# Altium schematic sheet a0206-2006.8.SchDoc
size 558 x 431 mm
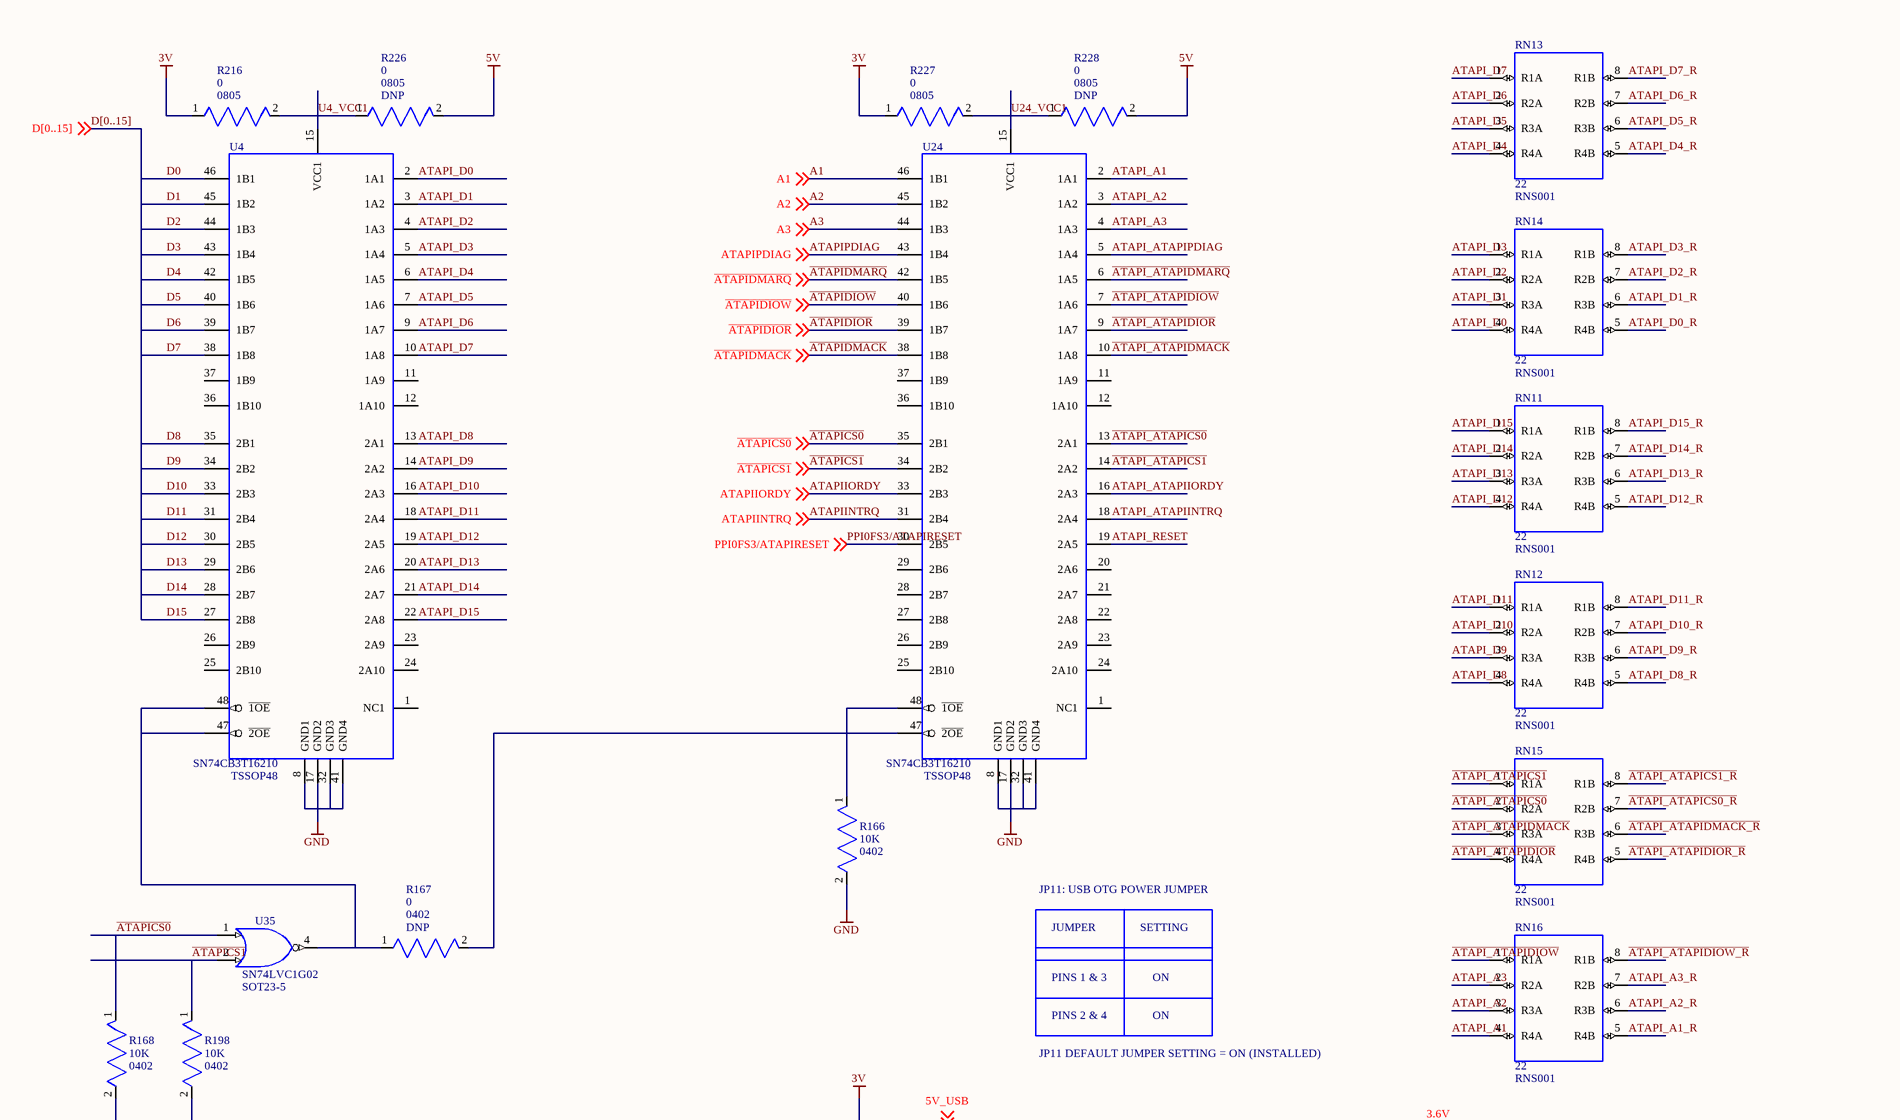
[diagram p0: a0206-2006.8.SchDoc, top left]
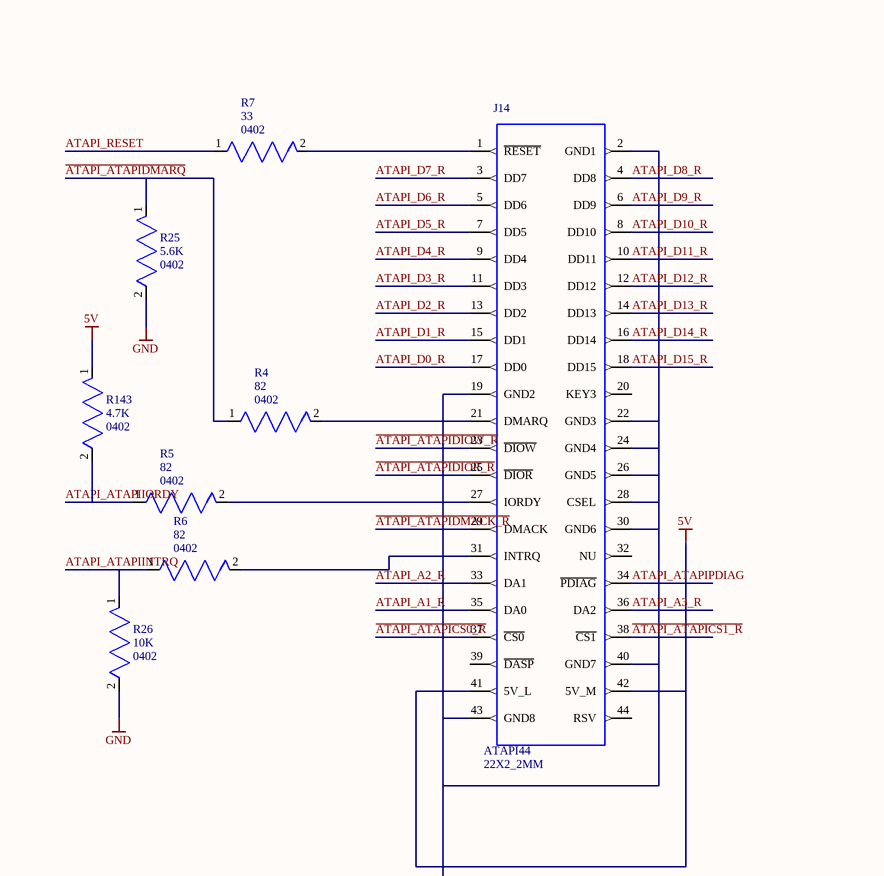
[diagram p1: a0206-2006.8.SchDoc, top right]
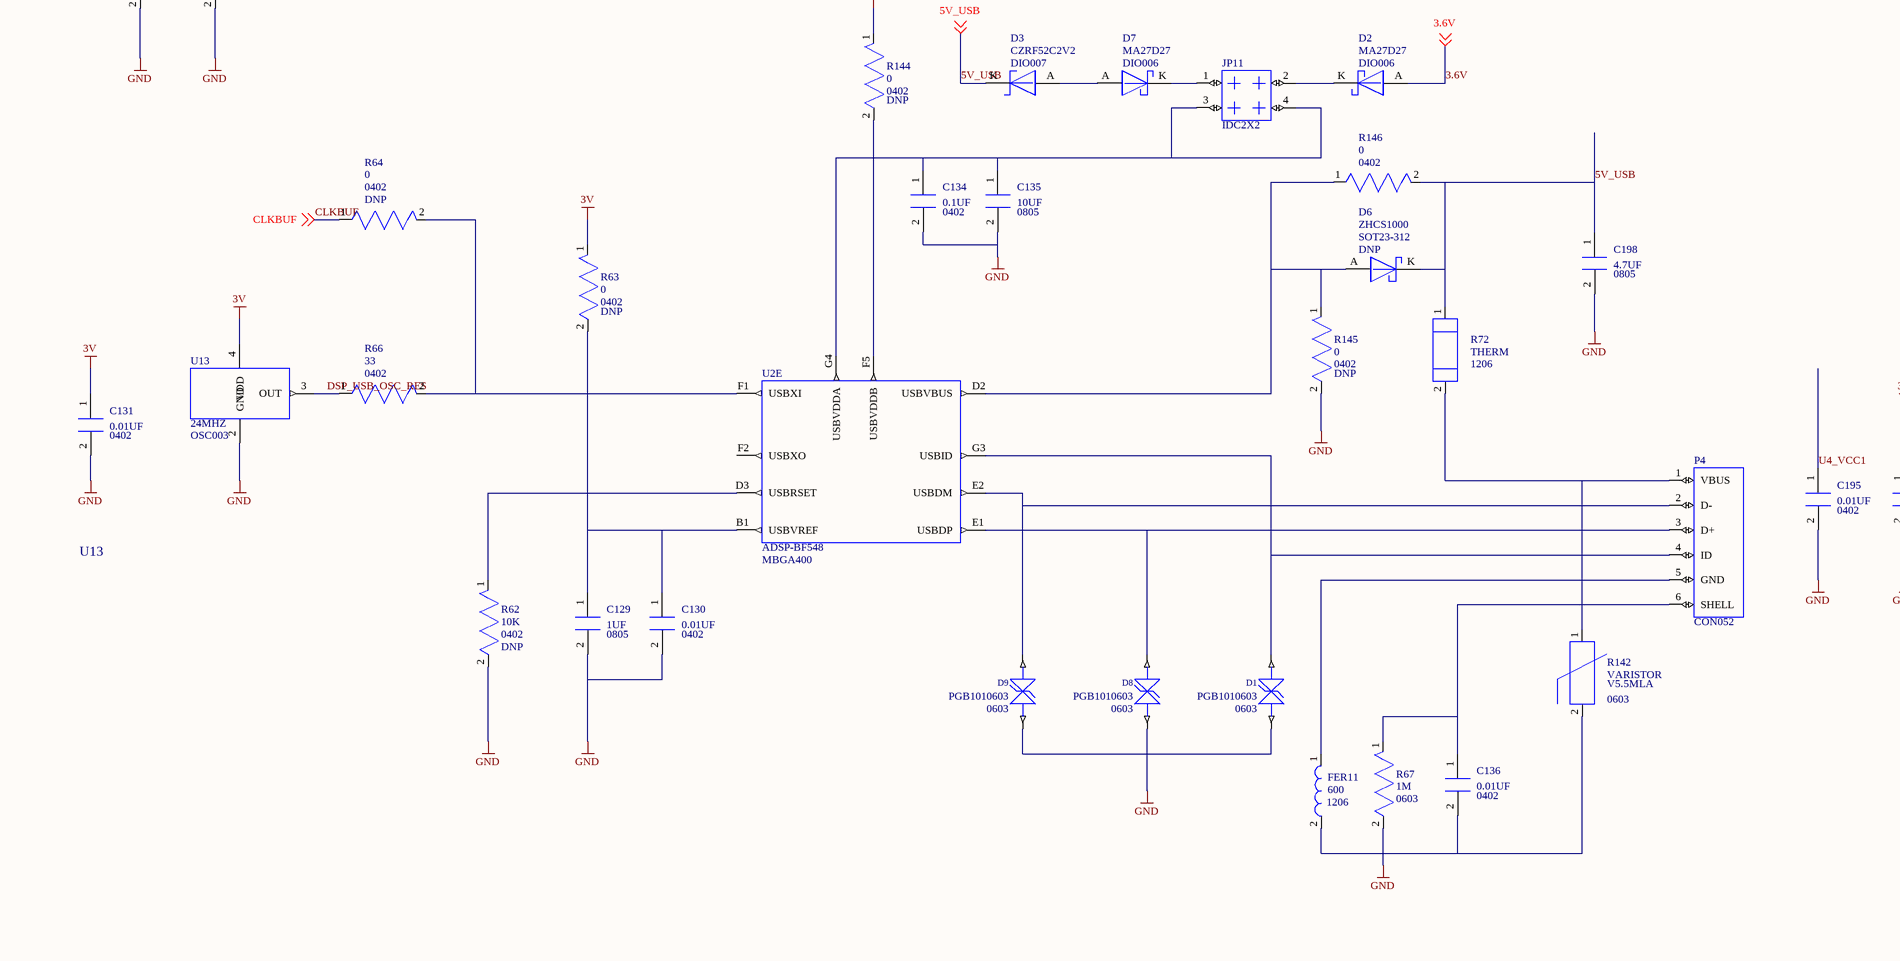
[diagram p2: a0206-2006.8.SchDoc, bottom left]
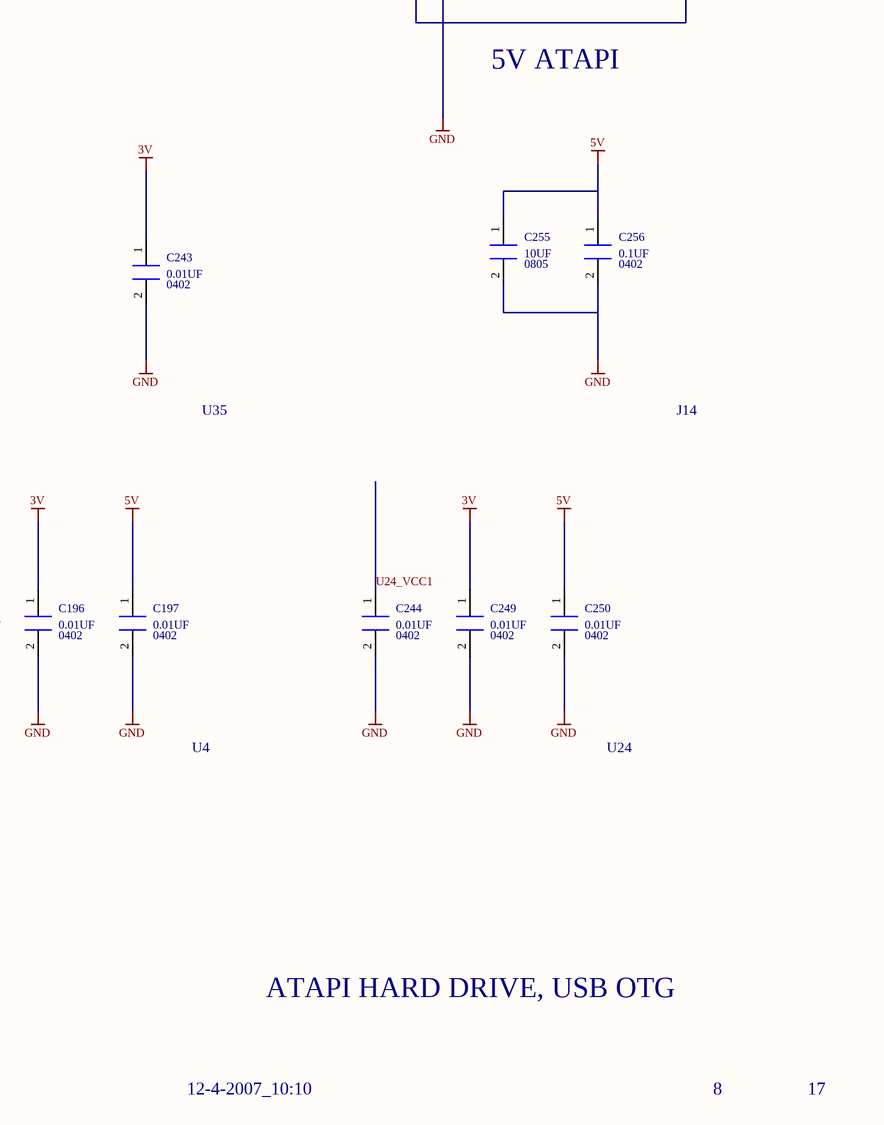
[diagram p3: a0206-2006.8.SchDoc, bottom right]

## Parts
C129  value 1UF  [0805]  (hidden comment: *)
C130  value 0.01UF  [0402]  (hidden comment: *)
C131  value 0.01UF  [0402]  (hidden comment: *)
C134  value 0.1UF  [0402]  (hidden comment: *)
C135  value 10UF  [0805]  (hidden comment: *)
C136  value 0.01UF  [0402]  (hidden comment: *)
C195  value 0.01UF  [0402]  (hidden comment: *)
C196  value 0.01UF  [0402]  (hidden comment: *)
C197  value 0.01UF  [0402]  (hidden comment: *)
C198  value 4.7UF  [0805]  (hidden comment: *)
C243  value 0.01UF  [0402]  (hidden comment: *)
C244  value 0.01UF  [0402]  (hidden comment: *)
C249  value 0.01UF  [0402]  (hidden comment: *)
C250  value 0.01UF  [0402]  (hidden comment: *)
C255  value 10UF  [0805]  (hidden comment: *)
C256  value 0.1UF  [0402]  (hidden comment: *)
D1  PART: PGB1010603  [0603]  (hidden comment: *)
D2  PART: MA27D27  [DIO006]  (hidden comment: *)
D3  PART: CZRF52C2V2  [DIO007]  (hidden comment: *)
D6  PART: ZHCS1000  CLASS: DNP  [SOT23-312]  (hidden comment: *)
D7  PART: MA27D27  [DIO006]  (hidden comment: *)
D8  PART: PGB1010603  [0603]  (hidden comment: *)
D9  PART: PGB1010603  [0603]  (hidden comment: *)
FER11  value 600  [1206]  (hidden comment: *)
J14  ATAPI44  [22X2_2MM]
JP11  *  [IDC2X2]  (value not drawn)
P4  *  [CON052]  (value not drawn)
R4  value 82  [0402]  (hidden comment: *)
R5  value 82  [0402]  (hidden comment: *)
R6  value 82  [0402]  (hidden comment: *)
R7  value 33  [0402]  (hidden comment: *)
R25  value 5.6K  [0402]  (hidden comment: *)
R26  value 10K  [0402]  (hidden comment: *)
R62  value 10K  CLASS: DNP  [0402]  (hidden comment: *)
R63  value 0  CLASS: DNP  [0402]  (hidden comment: *)
R64  value 0  CLASS: DNP  [0402]  (hidden comment: *)
R66  value 33  [0402]  (hidden comment: *)
R67  value 1M  [0603]  (hidden comment: *)
R72  value THERM  [1206]  (hidden comment: *)
R142  value VARISTOR  POWER: V5.5MLA  [0603]  (hidden comment: *)
R143  value 4.7K  [0402]  (hidden comment: *)
R144  value 0  CLASS: DNP  [0402]  (hidden comment: *)
R145  value 0  CLASS: DNP  [0402]  (hidden comment: *)
R146  value 0  [0402]  (hidden comment: *)
R166  value 10K  [0402]  (hidden comment: *)
R167  value 0  CLASS: DNP  [0402]  (hidden comment: *)
R168  value 10K  [0402]  (hidden comment: *)
R198  value 10K  [0402]  (hidden comment: *)
R216  value 0  [0805]  (hidden comment: *)
R226  value 0  CLASS: DNP  [0805]  (hidden comment: *)
R227  value 0  [0805]  (hidden comment: *)
R228  value 0  CLASS: DNP  [0805]  (hidden comment: *)
RN11  value 22  [RNS001]  (hidden comment: *)
RN12  value 22  [RNS001]  (hidden comment: *)
RN13  value 22  [RNS001]  (hidden comment: *)
RN14  value 22  [RNS001]  (hidden comment: *)
RN15  value 22  [RNS001]  (hidden comment: *)
RN16  value 22  [RNS001]  (hidden comment: *)
U2  PART: ADSP-BF548  PKG_TYPE: MBGA400  (hidden comment: ICS_ADSPBF548)  (part E of 7)
U4  PART: SN74CB3T16210  [TSSOP48]  (hidden comment: *)
U13  value 24MHZ  [OSC003]  (hidden comment: *)
U24  PART: SN74CB3T16210  [TSSOP48]  (hidden comment: *)
U35  PART: SN74LVC1G02  [SOT23-5]  (hidden comment: *)

## Nets
3V: C131.1(A) C196.1(A) C243.1(A) C249.1(A) R63.1(N1) R144.1(N1) R216.1(N1) R227.1(N1) U13.4(VDD) U35.5(3V)
5V: C197.1(A) C250.1(A) C255.1(A) C256.1(A) J14.41(5V_L) J14.42(5V_M) R143.1(N1) R226.2(N2) R228.2(N2)
GND: C129.2(B) C130.2(B) C131.2(B) C134.2(B) C135.2(B) C136.2(B) C195.2(B) C196.2(B) C197.2(B) C198.2(B) C243.2(B) C244.2(B) C249.2(B) C250.2(B) C255.2(B) C256.2(B) D1.1(ANODE) D8.1(ANODE) D9.1(ANODE) FER11.2(B) J14.2(GND1) J14.19(GND2) J14.22(GND3) J14.24(GND4) J14.26(GND5) J14.28(CSEL) J14.30(GND6) J14.40(GND7) J14.43(GND8) R25.2(N2) R26.2(N2) R62.2(N2) R67.2(N2) R142.2(N2) R145.2(N2) R166.2(N2) R168.2(N2) R198.2(N2) U4.8(GND1) U4.17(GND2) U4.32(GND3) U4.41(GND4) U13.2(GND) U24.8(GND1) U24.17(GND2) U24.32(GND3) U24.41(GND4) U35.3(GND)
USB_SHELL: P4.7(USB_SHELL) P4.8(USB_SHELL) P4.9(USB_SHELL)
3.6V: D2.A(ANODE) ; off-sheet 3.6V
5V_USB: C198.1(A) D3.K(CATHODE) D6.K(CATHODE) R72.1(N1) R146.2(N2) ; off-sheet 5V_USB
A1: U24.46(1B1) ; off-sheet A1
A2: U24.45(1B2) ; off-sheet A2
A3: U24.44(1B3) ; off-sheet A3
~{ATAPI_ATAPICS0}: RN15.2(R2A) U24.13(2A1)
~{ATAPI_ATAPICS0_R}: J14.37(~{CS0}) RN15.7(R2B)
~{ATAPI_ATAPICS1}: RN15.1(R1A) U24.14(2A2)
~{ATAPI_ATAPICS1_R}: J14.38(~{CS1}) RN15.8(R1B)
~{ATAPI_ATAPIDIOR}: RN15.4(R4A) U24.9(1A7)
~{ATAPI_ATAPIDIOR_R}: J14.25(~{DIOR}) RN15.5(R4B)
~{ATAPI_ATAPIDIOW}: RN16.1(R1A) U24.7(1A6)
~{ATAPI_ATAPIDIOW_R}: J14.23(~{DIOW}) RN16.8(R1B)
~{ATAPI_ATAPIDMACK}: RN15.3(R3A) U24.10(1A8)
~{ATAPI_ATAPIDMACK_R}: J14.29(DMACK) RN15.6(R3B)
~{ATAPI_ATAPIDMARQ}: R4.1(N1) R25.1(N1) U24.6(1A5)
~{ATAPICS0}: R168.1(N1) U24.35(2B1) U35.1(A) ; off-sheet ~{ATAPICS0}
~{ATAPICS1}: R198.1(N1) U24.34(2B2) U35.2(B) ; off-sheet ~{ATAPICS1}
~{ATAPIDIOR}: U24.39(1B7) ; off-sheet ~{ATAPIDIOR}
~{ATAPIDIOW}: U24.40(1B6) ; off-sheet ~{ATAPIDIOW}
~{ATAPIDMACK}: U24.38(1B8) ; off-sheet ~{ATAPIDMACK}
~{ATAPIDMARQ}: U24.42(1B5) ; off-sheet ~{ATAPIDMARQ}
ATAPI_A1: RN16.4(R4A) U24.2(1A1)
ATAPI_A1_R: J14.35(DA0) RN16.5(R4B)
ATAPI_A2: RN16.3(R3A) U24.3(1A2)
ATAPI_A2_R: J14.33(DA1) RN16.6(R3B)
ATAPI_A3: RN16.2(R2A) U24.4(1A3)
ATAPI_A3_R: J14.36(DA2) RN16.7(R2B)
ATAPI_ATAPIINTRQ: R6.1(N1) R26.1(N1) U24.18(2A4)
ATAPI_ATAPIIORDY: R5.1(N1) R143.2(N2) U24.16(2A3)
ATAPI_ATAPIPDIAG: J14.34(~{PDIAG}) U24.5(1A4)
ATAPI_D0: RN14.4(R4A) U4.2(1A1)
ATAPI_D0_R: J14.17(DD0) RN14.5(R4B)
ATAPI_D1: RN14.3(R3A) U4.3(1A2)
ATAPI_D1_R: J14.15(DD1) RN14.6(R3B)
ATAPI_D2: RN14.2(R2A) U4.4(1A3)
ATAPI_D2_R: J14.13(DD2) RN14.7(R2B)
ATAPI_D3: RN14.1(R1A) U4.5(1A4)
ATAPI_D3_R: J14.11(DD3) RN14.8(R1B)
ATAPI_D4: RN13.4(R4A) U4.6(1A5)
ATAPI_D4_R: J14.9(DD4) RN13.5(R4B)
ATAPI_D5: RN13.3(R3A) U4.7(1A6)
ATAPI_D5_R: J14.7(DD5) RN13.6(R3B)
ATAPI_D6: RN13.2(R2A) U4.9(1A7)
ATAPI_D6_R: J14.5(DD6) RN13.7(R2B)
ATAPI_D7: RN13.1(R1A) U4.10(1A8)
ATAPI_D7_R: J14.3(DD7) RN13.8(R1B)
ATAPI_D8: RN12.4(R4A) U4.13(2A1)
ATAPI_D8_R: J14.4(DD8) RN12.5(R4B)
ATAPI_D9: RN12.3(R3A) U4.14(2A2)
ATAPI_D9_R: J14.6(DD9) RN12.6(R3B)
ATAPI_D10: RN12.2(R2A) U4.16(2A3)
ATAPI_D10_R: J14.8(DD10) RN12.7(R2B)
ATAPI_D11: RN12.1(R1A) U4.18(2A4)
ATAPI_D11_R: J14.10(DD11) RN12.8(R1B)
ATAPI_D12: RN11.4(R4A) U4.19(2A5)
ATAPI_D12_R: J14.12(DD12) RN11.5(R4B)
ATAPI_D13: RN11.3(R3A) U4.20(2A6)
ATAPI_D13_R: J14.14(DD13) RN11.6(R3B)
ATAPI_D14: RN11.2(R2A) U4.21(2A7)
ATAPI_D14_R: J14.16(DD14) RN11.7(R2B)
ATAPI_D15: RN11.1(R1A) U4.22(2A8)
ATAPI_D15_R: J14.18(DD15) RN11.8(R1B)
ATAPI_RESET: R7.1(N1) U24.19(2A5)
ATAPIINTRQ: U24.31(2B4) ; off-sheet ATAPIINTRQ
ATAPIIORDY: U24.33(2B3) ; off-sheet ATAPIIORDY
ATAPIPDIAG: U24.43(1B4) ; off-sheet ATAPIPDIAG
CLKBUF: R64.1(N1) ; off-sheet CLKBUF
D0: U4.46(1B1)
D1: U4.45(1B2)
D2: U4.44(1B3)
D3: U4.43(1B4)
D4: U4.42(1B5)
D5: U4.40(1B6)
D6: U4.39(1B7)
D7: U4.38(1B8)
D8: U4.35(2B1)
D9: U4.34(2B2)
D10: U4.33(2B3)
D11: U4.31(2B4)
D12: U4.30(2B5)
D13: U4.29(2B6)
D14: U4.28(2B7)
D15: U4.27(2B8)
DSP_USB_OSC_RES: R66.1(N1) U13.3(OUT)
PPI0FS3/ATAPIRESET: U24.30(2B5) ; off-sheet PPI0FS3/ATAPIRESET
U4_VCC1: C195.1(A) R216.2(N2) R226.1(N1) U4.15(VCC1)
U24_VCC1: C244.1(A) R227.2(N2) R228.1(N1) U24.15(VCC1)
NetC129_1: C129.1(A) C130.1(A) R63.2(N2) U2.B1(USBVREF)
NetC134_1: C134.1(A) C135.1(A) JP11.3 JP11.4 R144.2(N2) U2.F5(USBVDDB) U2.G4(USBVDDA)
NetC136_1: C136.1(A) P4.6(SHELL) R67.1(N1)
NetD1_2: D1.2(CATHODE) P4.4(ID) U2.G3(USBID)
NetD2_K: D2.K(CATHODE) JP11.2
NetD3_A: D3.A(ANODE) D7.A(ANODE)
NetD6_A: D6.A(ANODE) R145.1(N1) R146.1(N1) U2.D2(USBVBUS)
NetD7_K: D7.K(CATHODE) JP11.1
NetD8_2: D8.2(CATHODE) P4.3(D+) U2.E1(USBDP)
NetD9_2: D9.2(CATHODE) P4.2(D-) U2.E2(USBDM)
NetFER11_1: FER11.1(A) P4.5(GND)
NetJ14_1: J14.1(~{RESET}) R7.2(N2)
NetJ14_21: J14.21(DMARQ) R4.2(N2)
NetJ14_27: J14.27(IORDY) R5.2(N2)
NetJ14_31: J14.31(INTRQ) R6.2(N2)
NetP4_1: P4.1(VBUS) R72.2(N2) R142.1(N1)
NetR62_1: R62.1(N1) U2.D3(USBRSET)
NetR64_2: R64.2(N2) R66.2(N2) U2.F1(USBXI)
NetR166_1: R166.1(N1) R167.2(N2) U24.47(~{2OE}) U24.48(~{1OE})
NetR167_1: R167.1(N1) U4.47(~{2OE}) U4.48(~{1OE}) U35.4(Y)

Not connected (* = marked no-connect by the designer): J14 20(KEY3) 32(NU) 39(~{DASP}) 44(RSV); U2 F2(USBXO); U4 1(NC1) 11(1A9) 12(1A10) 23(2A9) 24(2A10) 25(2B10) 26(2B9) 36(1B10) 37(1B9); U13 1; U24 1(NC1) 11(1A9) 12(1A10) 20(2A6) 21(2A7) 22(2A8) 23(2A9) 24(2A10) 25(2B10) 26(2B9) 27(2B8) 28(2B7) 29(2B6) 36(1B10) 37(1B9)

## Buses and harness runs
bus D[0..15]

## Notes on the sheet
- JP11: USB OTG POWER JUMPER
- PINS 1 & 3
- JUMPER
- SETTING
- ON
- PINS 2 & 4
- JP11 DEFAULT JUMPER SETTING = ON (INSTALLED)
- 5V ATAPI
- U35
- J14
- U13
- U4
- U24
- ATAPI HARD DRIVE, USB OTG
- 12-4-2007_10:10
- 8
- 17
- A
- B
- C
- D
- 1
- 2
- 3
- 20 Cotton Road
- 4
- DEVICES
- ANALOG
- Nashua, NH 03063
- PH: 1-800-ANALOGD
- Title
- ADSP-BF548 EZ-KIT LITE
- Size
- Board No.
- A0206-2006
- Rev
- 1.4B
- Date
- Sheet
- of

## Library data of the parts
C129 = CAP_NON_POLARIZED.2: PART_SPEC: CAPACITOR; LEVEL: STD; TOLERANCE: 10%; VOLTAGE: 16V; TYPE: X7R; PRT_NUM: 7000143; PKG_TYPE: 0805; ROHS: ROHS
C130 C136 = CAP_NON_POLARIZED.2: PART_SPEC: CAPACITOR; LEVEL: STD; TOLERANCE: 10%; VOLTAGE: 16V; TYPE: X7R; PRT_NUM: 7000279; PKG_TYPE: 0402; ROHS: ROHS
C131 C195 C197 C243 C249 = CAP_NON_POLARIZED.2: PART_SPEC: CAPACITOR; LEVEL: STD; TYPE: X7R; BOARDS: BOTH; TOLERANCE: 10%; VOLTAGE: 16V; PRT_NUM: 7000279; PKG_TYPE: 0402; ROHS: ROHS
C134 = CAP_NON_POLARIZED.2: PART_SPEC: CAPACITOR; LEVEL: STD; PRT_NUM: 7000278; TYPE: X5R; VOLTAGE: 10V; TOLERANCE: 10%; PKG_TYPE: 0402; ROHS: ROHS
C135 = CAP_NON_POLARIZED.2: PART_SPEC: CAPACITOR; LEVEL: STD; PRT_NUM: 7000461; TYPE: X5R CER; VOLTAGE: 10V; TOLERANCE: 10%; PKG_TYPE: 0805; ROHS: ROHS
C196 C244 C250 = CAP_NON_POLARIZED.2: PART_SPEC: CAPACITOR; LEVEL: STD; PRT_NUM: 7000279; VOLTAGE: 16V; TOLERANCE: 10%; BOARDS: BOTH; TYPE: X7R; PKG_TYPE: 0402; ROHS: ROHS
C198 = CAP_NON_POLARIZED.2: PART_SPEC: CAPACITOR; LEVEL: STD; TOLERANCE: 10%; VOLTAGE: 6.3V; TYPE: X5R; PRT_NUM: 7000275; PKG_TYPE: 0805; ROHS: ROHS
C255 = CAP_NON_POLARIZED.2: PART_SPEC: CAPACITOR; LEVEL: STD; PRT_NUM: 7000265; TYPE: X5R; VOLTAGE: 6.3V; TOLERANCE: 10%; PKG_TYPE: 0805; ROHS: ROHS
C256 = CAP_NON_POLARIZED.2: PART_SPEC: CAPACITOR; LEVEL: STD; TOLERANCE: 10%; VOLTAGE: 10V; TYPE: X5R; PRT_NUM: 7000278; PKG_TYPE: 0402; ROHS: ROHS
D1 D8 D9 = DIO_SUPRESSOR.1: ESD SUPPRESSOR; LEVEL: STD; CURRENT: 15KV; PRT_NUM: 7000555; PKG_TYPE: 0603; ROHS: ROHS; WEB: http://www.littelfuse.com/cgi-bin/r.cgi/en/prod_parts.html?PartID
D2 = DIO_SCHOTTKY.2: SCHOTTKY BARRIER; LEVEL: STD; CURRENT: 100MA; PRT_NUM: 7000560; PKG_TYPE: DIO006; WEB: http://www.semicon.panasonic.co.jp/ds/eng/SKH00122AED.pdf; ROHS: ROHS
D3 = DIO_ZENER2P.1: ZENER; LEVEL: STD; CURRENT: 2A; PRT_NUM: 7000562; PKG_TYPE: DIO007; ROHS: ROHS; WEB: http://www.comchiptech.com/docs/CZRF52series.pdf
D6 = DIO_SCHOTTKY_3.3: SCHOTTKY; LEVEL: STD; CURRENT: 1A; PRT_NUM: 7000252; PKG_TYPE: SOT23-312; WEB: http://www.zetex.com/3.0/3-3-3.asp?pn; ROHS: ROHS
D7 = DIO_SCHOTTKY.1: SCHOTTKY BARRIER; LEVEL: STD; CURRENT: 100MA; PRT_NUM: 7000560; PKG_TYPE: DIO006; WEB: http://www.semicon.panasonic.co.jp/ds/eng/SKH00122AED.pdf; ROHS: ROHS
FER11 = FER_STANDARD.2: PART_SPEC: FERRITE; LEVEL: STD; CURRENT: 500MA; FREQ: 100MHZ; PRT_NUM: 7000117; PKG_TYPE: 1206; ROHS: ROHS
J14 = CON_ATAPI_44.1: SOCKET RA; LEVEL: STD; PRT_NUM: 6000831; CONFIGURATION: 44PIN; DEVICE: ATAPI44; PKG_TYPE: 22X2_2MM; TYPE: ATAPI44; ROHS: ROHS
JP11 = CON_JP_2X2.1: HEADER; PART_SPEC: CONNECTOR; LEVEL: STD; PRT_NUM: 6000797; CONFIGURATION: 2X2; PKG_TYPE: IDC2X2; TYPE: IDC; ROHS: ROHS
P4 = CON_USB_MINI_AB.1: USB OTG CONN; PART_SPEC: CONNECTOR; LEVEL: STD; CONFIGURATION: 5PIN; PRT_NUM: 6000828; PKG_TYPE: CON052; ROHS: ROHS; TYPE: USB_MINI-AB
R4 R6 = RES_STANDARD.1: PART_SPEC: RESISTOR; LEVEL: STD; PRT_NUM: 7000573; TOLERANCE: 5%; POWER: 1/16W; PKG_TYPE: 0402; ROHS: ROHS
R5 = RES_STANDARD.1: PART_SPEC: RESISTOR; LEVEL: STD; PRT_NUM: 7000573; POWER: 1/16W; TOLERANCE: 5%; PKG_TYPE: 0402; ROHS: ROHS
R7 = RES_STANDARD.1: PART_SPEC: RESISTOR; LEVEL: STD; PRT_NUM: 7000285; POWER: 1/16W; TOLERANCE: 5%; PKG_TYPE: 0402; ROHS: ROHS
R25 = RES_STANDARD.2: PART_SPEC: RESISTOR; LEVEL: STD; PRT_NUM: 7000569; TOLERANCE: 5%; BOARDS: BOTH; POWER: 1/16W; PKG_TYPE: 0402; ROHS: ROHS
R26 R168 = RES_STANDARD.2: PART_SPEC: RESISTOR; LEVEL: STD; POWER: 1/16W; BOARDS: BOTH; TOLERANCE: 5%; PRT_NUM: 7000280; PKG_TYPE: 0402; ROHS: ROHS
R62 R166 R198 = RES_STANDARD.2: PART_SPEC: RESISTOR; LEVEL: STD; PRT_NUM: 7000280; TOLERANCE: 5%; BOARDS: BOTH; POWER: 1/16W; PKG_TYPE: 0402; ROHS: ROHS
R63 R144 R145 = RES_STANDARD.2: PART_SPEC: RESISTOR; LEVEL: STD; TOLERANCE: 5%; POWER: 1/16W; PRT_NUM: 7000282; PKG_TYPE: 0402; ROHS: ROHS
R64 = RES_STANDARD.1: PART_SPEC: RESISTOR; LEVEL: STD; TOLERANCE: 5%; POWER: 1/16W; PRT_NUM: 7000282; PKG_TYPE: 0402; ROHS: ROHS
R66 = RES_STANDARD.1: PART_SPEC: RESISTOR; LEVEL: STD; POWER: 1/16W; BOARDS: BOTH; TOLERANCE: 5%; PRT_NUM: 7000285; PKG_TYPE: 0402; ROHS: ROHS
R67 = RES_STANDARD.2: PART_SPEC: RESISTOR; LEVEL: STD; TOLERANCE: 5%; POWER: 1/10W; PRT_NUM: 7000369; PKG_TYPE: 0603; ROHS: ROHS
R72 = RES_THERMISTOR.1: PART_SPEC: RESISTOR; LEVEL: STD; POWER: 0.5A; TOLERANCE: 0.4; PRT_NUM: 7000557; PKG_TYPE: 1206; ROHS: ROHS
R142 = RES_VARISTOR.1: PART_SPEC: RESISTOR; LEVEL: STD; TOLERANCE: 30A; PRT_NUM: 7000556; PKG_TYPE: 0603; ROHS: ROHS
R143 = RES_STANDARD.2: PART_SPEC: RESISTOR; LEVEL: STD; PRT_NUM: 7000281; TOLERANCE: 5%; BOARDS: BOTH; POWER: 1/16W; PKG_TYPE: 0402; ROHS: ROHS
R146 = RES_STANDARD.1: PART_SPEC: RESISTOR; LEVEL: STD; POWER: 1/16W; BOARDS: BOTH; TOLERANCE: 5%; PRT_NUM: 7000282; PKG_TYPE: 0402; ROHS: ROHS
R167 = RES_STANDARD.1: PART_SPEC: RESISTOR; LEVEL: STD; PRT_NUM: 7000282; POWER: 1/16W; TOLERANCE: 5%; PKG_TYPE: 0402; ROHS: ROHS
R216 R227 = RES_STANDARD.1: PART_SPEC: RESISTOR; LEVEL: STD; PRT_NUM: 7000228; POWER: 1/10W; TOLERANCE: 5%; PKG_TYPE: 0805; ROHS: ROHS
R226 R228 = RES_STANDARD.1: PART_SPEC: RESISTOR; LEVEL: STD; TOLERANCE: 5%; POWER: 1/10W; PRT_NUM: 7000228; PKG_TYPE: 0805; ROHS: ROHS
RN11-RN13 RN16 = RNET_4SERIES.1: SERIES; PART_SPEC: RESISTOR_NETWORK; LEVEL: STD; PRT_NUM: 7000257; POWER: 125MW; TOLERANCE: 5%; PKG_TYPE: RNS001; ROHS: ROHS
RN14 RN15 = RNET_4SERIES.1: SERIES; PART_SPEC: RESISTOR_NETWORK; LEVEL: STD; TOLERANCE: 5%; POWER: 125MW; PRT_NUM: 7000257; PKG_TYPE: RNS001; ROHS: ROHS
U2 = ICS_ADSPBF548_A: 600 MHZ; LEVEL: STD; PRT_NUM: 30-025548-02; DEVICE: ICS_ADSPBF548; ROHS: ROHS; WEB: http://www.analog.com/en/prod/0,2877,ADSP%252DBF548,00.html
U4 U24 = ICS_SN74CB3T16210.1: 20BIT FET SWT W/LVL SHIFT; LEVEL: STD; PRT_NUM: 1000455; PKG_TYPE: TSSOP48; WEB: http://focus.ti.com/docs/prod/folders/print/sn74cb3t16210.html; ROHS: ROHS
U13 = OSC_SMT.2: OSCILLATOR; NC: 1; LEVEL: STD; PRT_NUM: 1000422; PART_SPEC: OSCILLATOR; PKG_TYPE: OSC003; ROHS: ROHS
U35 = ICS_SN74XXX1G02.1: SINGLE 2-INPUT NOR-LW TPD; LEVEL: STD; PRT_NUM: 1000437; PKG_TYPE: SOT23-5; ROHS: ROHS; WEB: http://focus.ti.com/docs/prod/folders/print/sn74lvc1g02.html